# Altium project Walkman.PrjPcb
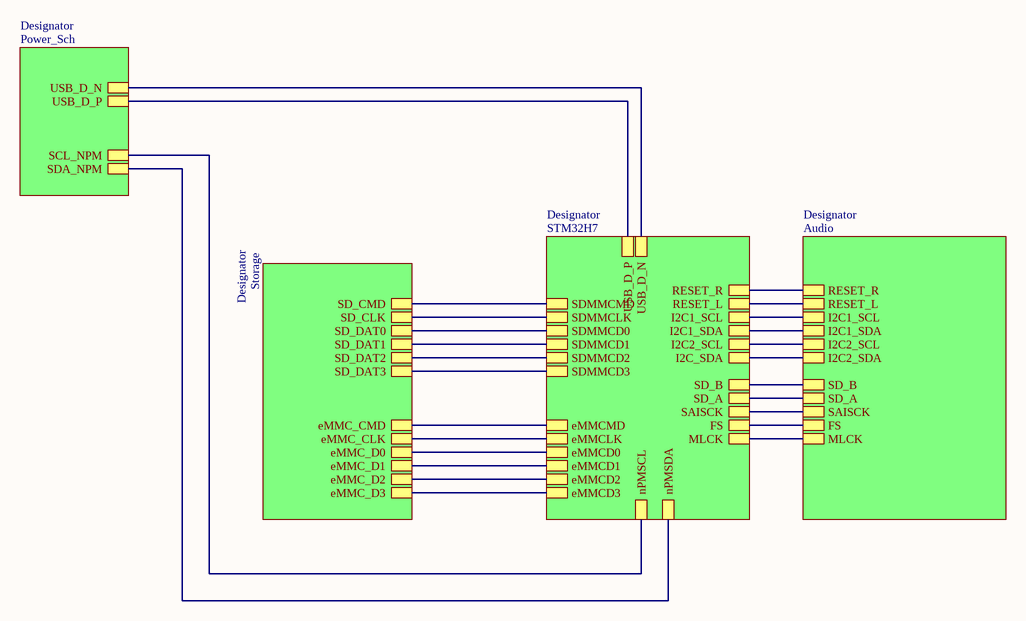
[diagram p0: Master_Schematic.SchDoc]
7 sheets, 80 parts. Net scope: hierarchical (ports join the sheet entries above them; power ports are global).
Board files: PCB1.PcbDoc, PCB2.PcbDoc, PCjnB3.PcbDoc
Sheets:
  Master_Schematic.SchDoc
    Designator = STM32H7.SchDoc
    Designator = Audio.SchDoc
    Designator = Storage.SchDoc
    Designator = Power_Sch.SchDoc
  allparts.SchDoc
  Sheet2.SchDoc

## Sheet Master_Schematic.SchDoc
size A4; SheetNumber: 1; SheetTotal: 7

### Sub-sheets
Designator = STM32H7: eMMCD3, eMMCD2, eMMCD1, eMMCD0, eMMCLK, eMMCMD, SDMMCD1, SDMMCD0, SDMMCD2, SDMMCD3, SDMMCMD, SDMMCLK, RESET_R, RESET_L, I2C_SDA, I2C1_SCL, I2C2_SCL, I2C1_SDA, MLCK, SAISCK, FS, SD_B, SD_A, nPMSDA, nPMSCL, USB_D_N, USB_D_P
Designator = Audio: MLCK, FS, SAISCK, SD_A, SD_B, I2C2_SDA, I2C2_SCL, I2C1_SDA, I2C1_SCL, RESET_R, RESET_L
Designator = Storage: eMMC_CMD, eMMC_CLK, eMMC_D0, eMMC_D1, eMMC_D2, eMMC_D3, SD_CMD, SD_CLK, SD_DAT0, SD_DAT1, SD_DAT2, SD_DAT3
Designator = Power_Sch: SDA_NPM, SCL_NPM, USB_D_P, USB_D_N

### Nets
eMMC_CLK: sheet Designator/eMMCLK, sheet Designator/eMMC_CLK
eMMC_CMD: sheet Designator/eMMCMD, sheet Designator/eMMC_CMD
eMMC_D0: sheet Designator/eMMCD0, sheet Designator/eMMC_D0
eMMC_D1: sheet Designator/eMMCD1, sheet Designator/eMMC_D1
eMMC_D2: sheet Designator/eMMCD2, sheet Designator/eMMC_D2
eMMC_D3: sheet Designator/eMMCD3, sheet Designator/eMMC_D3
FS: sheet Designator/FS, sheet Designator/FS
I2C1_SCL: sheet Designator/I2C1_SCL, sheet Designator/I2C1_SCL
I2C1_SDA: sheet Designator/I2C1_SDA, sheet Designator/I2C1_SDA
I2C2_SCL: sheet Designator/I2C2_SCL, sheet Designator/I2C2_SCL
I2C2_SDA: sheet Designator/I2C_SDA, sheet Designator/I2C2_SDA
MLCK: sheet Designator/MLCK, sheet Designator/MLCK
nPMSCL: sheet Designator/nPMSCL, sheet Designator/SCL_NPM
nPMSDA: sheet Designator/nPMSDA, sheet Designator/SDA_NPM
RESET_L: sheet Designator/RESET_L, sheet Designator/RESET_L
RESET_R: sheet Designator/RESET_R, sheet Designator/RESET_R
SAISCK: sheet Designator/SAISCK, sheet Designator/SAISCK
SD_A: sheet Designator/SD_A, sheet Designator/SD_A
SD_B: sheet Designator/SD_B, sheet Designator/SD_B
SD_CLK: sheet Designator/SDMMCLK, sheet Designator/SD_CLK
SD_CMD: sheet Designator/SDMMCMD, sheet Designator/SD_CMD
SD_DAT0: sheet Designator/SDMMCD0, sheet Designator/SD_DAT0
SD_DAT1: sheet Designator/SDMMCD1, sheet Designator/SD_DAT1
SD_DAT2: sheet Designator/SDMMCD2, sheet Designator/SD_DAT2
SD_DAT3: sheet Designator/SDMMCD3, sheet Designator/SD_DAT3
USB_D_N: sheet Designator/USB_D_N, sheet Designator/USB_D_N
USB_D_P: sheet Designator/USB_D_P, sheet Designator/USB_D_P

## Sheet STM32H7.SchDoc
size A4; SheetNumber: 3; SheetTotal: 7
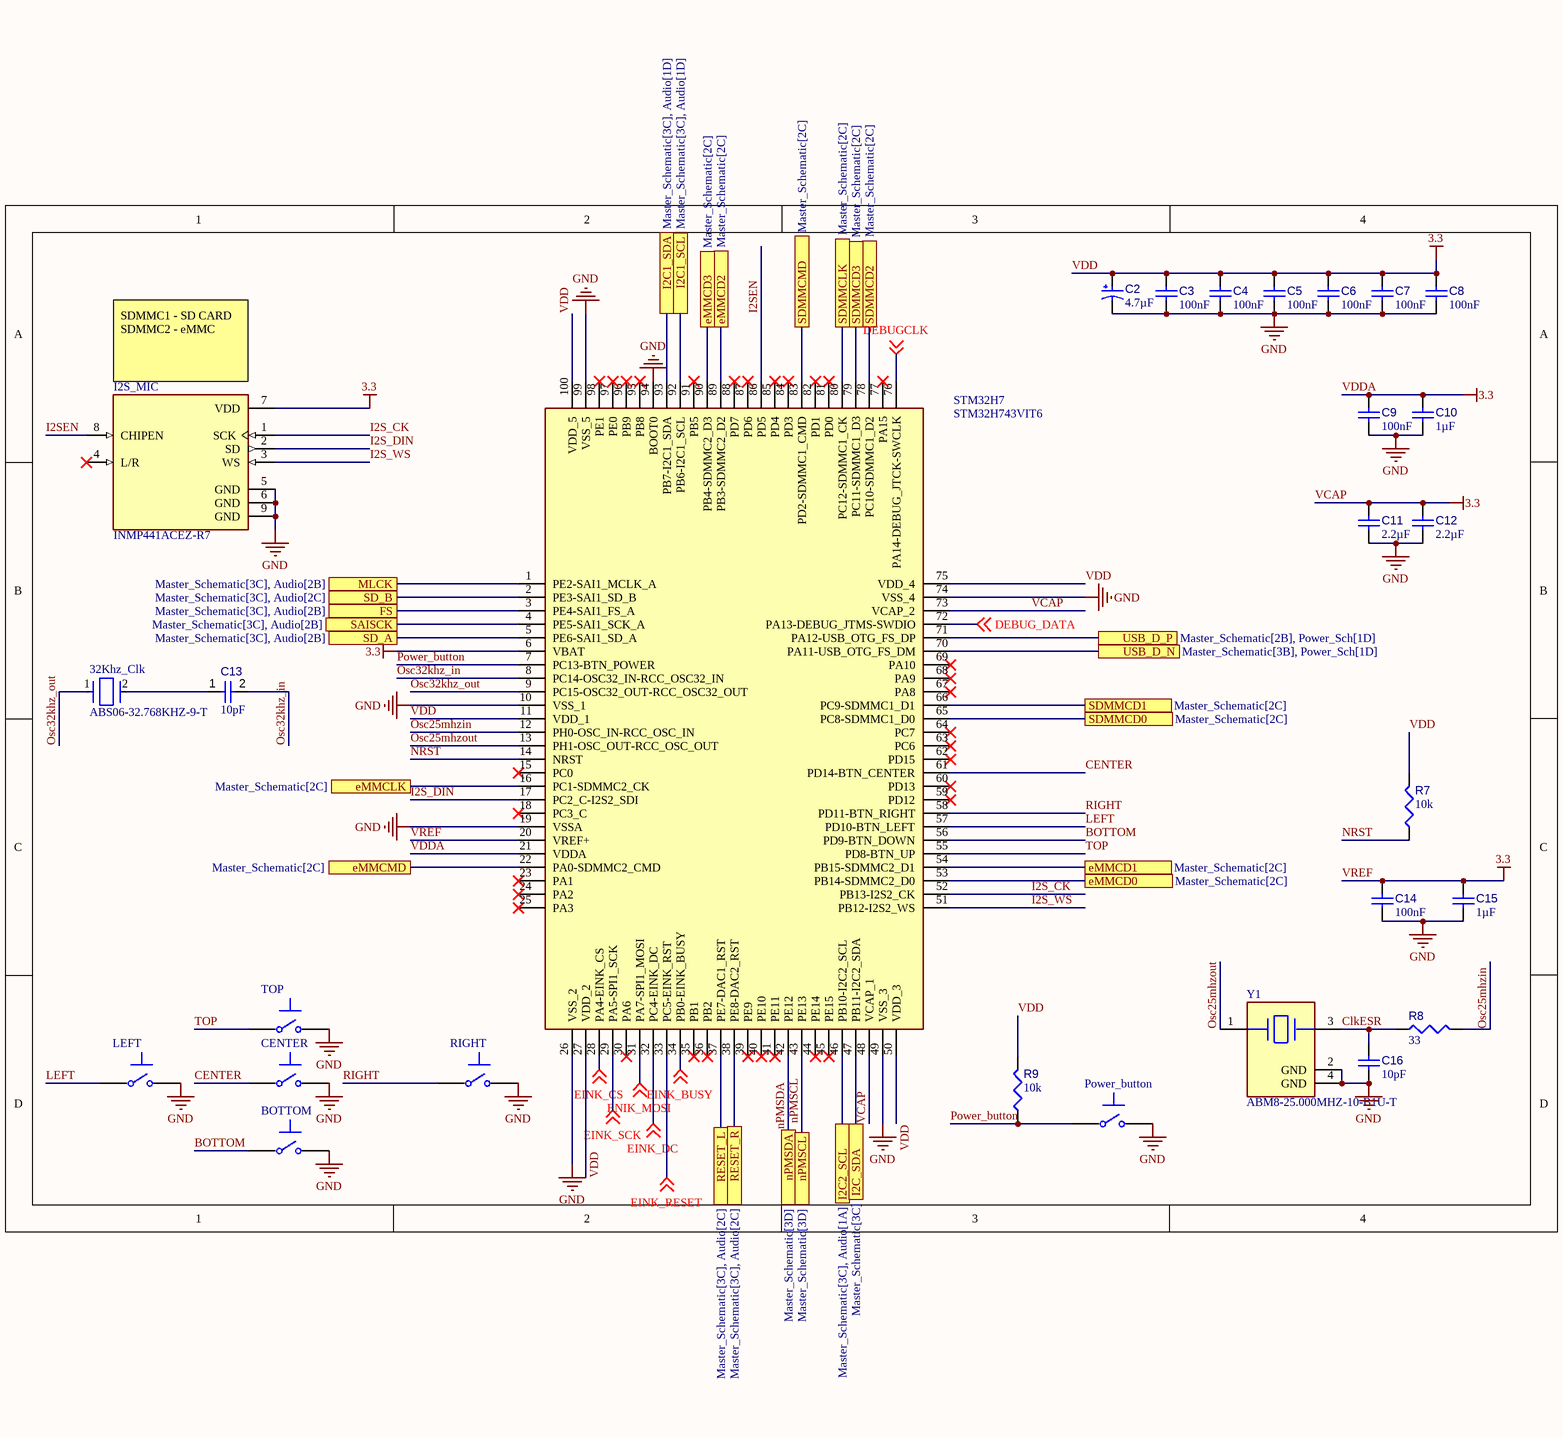
[diagram p1: STM32H7.SchDoc]

### Parts
32Khz_Clk  ABS06-32.768KHZ-9-T  [FP-ABS06-MFG]
BOTTOM  TL1015AF160QG  [FP-TL1015AF160QG-MFG]  (value not drawn)
C2  value 4.7µF  [AVX-TAJ-A-2_L]  (hidden comment: TAJA475K016RNJ)
C3  value 100nF  [CAPC0402(1005)60_L]  (hidden comment: Capacitor 100nF +/-20% 50V 0402)
C4  value 100nF  [CAPC0402(1005)60_L]  (hidden comment: Capacitor 100nF +/-20% 50V 0402)
C5  value 100nF  [CAPC0402(1005)60_L]  (hidden comment: Capacitor 100nF +/-20% 50V 0402)
C6  value 100nF  [CAPC0402(1005)60_L]  (hidden comment: Capacitor 100nF +/-20% 50V 0402)
C7  value 100nF  [CAPC0402(1005)60_L]  (hidden comment: Capacitor 100nF +/-20% 50V 0402)
C8  value 100nF  [CAPC0402(1005)60_L]  (hidden comment: Capacitor 100nF +/-20% 50V 0402)
C9  value 100nF  [CAPC0402(1005)60_L]  (hidden comment: Capacitor 100nF +/-20% 50V 0402)
C10  value 1µF  [CAPC1005X55X25LL05T10]  (hidden comment: Capacitor 1 uF +/- 10% 6.3 V 0402)
C11  value 2.2µF  [CAPC0402(1005)60_L]  (hidden comment: Capacitor 2,2µF +/-20% 10V 0402)
C12  value 2.2µF  [CAPC0402(1005)60_L]  (hidden comment: Capacitor 2,2µF +/-20% 10V 0402)
C13  value 10pF  [CAPC1005X55X25ML05T05]  (hidden comment: Capacitor 10 pF +/- 5% 50 V 0402)
C14  value 100nF  [CAPC1608X90X40NL10T20]  (hidden comment: Capacitor 100 nF +/-10% 50 V 0603)
C15  value 1µF  [CAPC1005X55X25LL05T10]  (hidden comment: Capacitor 1 uF +/- 10% 6.3 V 0402)
C16  value 10pF  [CAPC1608X87X35NL15T15]  (hidden comment: Capacitor 10 pF +/- 0.25 pF 50 V 0603)
CENTER  TL1015AF160QG  [FP-TL1015AF160QG-MFG]  (value not drawn)
I2S_MIC  INMP441ACEZ-R7  [MIC_INMP441ACEZ-R7]
LEFT  TL1015AF160QG  [FP-TL1015AF160QG-MFG]  (value not drawn)
Power_button  TL1015AF160QG  [FP-TL1015AF160QG-MFG]  (value not drawn)
R7  value 10k  [RESC0402(1005)_L]  (hidden comment: 10KR2F)
R8  value 33  [RESC0402(1005)_L]  (hidden comment: 33R2J)
R9  value 10k  [RESC0402(1005)_L]  (hidden comment: 10KR2F)
RIGHT  TL1015AF160QG  [FP-TL1015AF160QG-MFG]  (value not drawn)
STM32H7  STM32H743VIT6  [QFP50P1600X1600X160-100N]
TOP  TL1015AF160QG  [FP-TL1015AF160QG-MFG]  (value not drawn)
Y1  ABM8-25.000MHZ-10-B1U-T  [FP-ABM8-MFG]

### Ports
eMMCD0 (see Master_Schematic[2C]), eMMCD1 (see Master_Schematic[2C]), eMMCD2 (see Master_Schematic[2C]), eMMCD3 (see Master_Schematic[2C]), eMMCLK (see Master_Schematic[2C]), eMMCMD (see Master_Schematic[2C]), FS (see Master_Schematic[3C], Audio[2B]), I2C1_SCL (see Master_Schematic[3C], Audio[1D]), I2C1_SDA (see Master_Schematic[3C], Audio[1D]), I2C2_SCL (see Master_Schematic[3C], Audio[1A]), I2C_SDA (see Master_Schematic[3C]), MLCK (see Master_Schematic[3C], Audio[2B]), nPMSCL (see Master_Schematic[3D]), nPMSDA (see Master_Schematic[3D]), RESET_L (see Master_Schematic[3C], Audio[2C]), RESET_R (see Master_Schematic[3C], Audio[2C]), SAISCK (see Master_Schematic[3C], Audio[2B]), SD_A (see Master_Schematic[3C], Audio[2B]), SD_B (see Master_Schematic[3C], Audio[2C]), SDMMCD0 (see Master_Schematic[2C]), SDMMCD1 (see Master_Schematic[2C]), SDMMCD2 (see Master_Schematic[2C]), SDMMCD3 (see Master_Schematic[2C]), SDMMCLK (see Master_Schematic[2C]), SDMMCMD (see Master_Schematic[2C]), USB_D_N (see Master_Schematic[3B], Power_Sch[1D]), USB_D_P (see Master_Schematic[2B], Power_Sch[1D])

### Nets
GND: BOTTOM.2 C2.2 C3.1 C4.1 C5.1 C6.1 C7.1 C8.1 C9.1 C10.1 C11.1 C12.1 C14.1 C15.1 C16.1 CENTER.2 I2S_MIC.5(GND) I2S_MIC.6(GND) I2S_MIC.9(GND) LEFT.2 Power_button.2 RIGHT.2 STM32H7.10(VSS_1) STM32H7.19(VSSA) STM32H7.26(VSS_2) STM32H7.49(VSS_3) STM32H7.74(VSS_4) STM32H7.94(BOOT0) STM32H7.99(VSS_5) TOP.2 Y1.2(GND) Y1.4(GND)
VCAP: C2.1 C3.2 C4.2 C5.2 C6.2 C7.2 C8.2 C9.2 C10.2 C11.2 C12.2 C14.2 C15.2 I2S_MIC.7(VDD) R7.2 R9.2 STM32H7.6(VBAT) STM32H7.11(VDD_1) STM32H7.20(VREF+) STM32H7.21(VDDA) STM32H7.27(VDD_2) STM32H7.48(VCAP_1) STM32H7.50(VDD_3) STM32H7.73(VCAP_2) STM32H7.75(VDD_4) STM32H7.100(VDD_5)  [also labelled 3.3, VDD, VDDA, VREF]
BOTTOM: BOTTOM.1 STM32H7.56(PD9-BTN_DOWN)
CENTER: CENTER.1 STM32H7.61(PD14-BTN_CENTER)
ClkESR: C16.2 R8.1 Y1.3
DEBUG_DATA: STM32H7.72(PA13-DEBUG_JTMS-SWDIO) ; off-sheet DEBUG_DATA
DEBUGCLK: STM32H7.76(PA14-DEBUG_JTCK-SWCLK) ; off-sheet DEBUGCLK
EINK_BUSY: STM32H7.34(PB0-EINK_BUSY) ; off-sheet EINK_BUSY
EINK_CS: STM32H7.28(PA4-EINK_CS) ; off-sheet EINK_CS
EINK_DC: STM32H7.32(PC4-EINK_DC) ; off-sheet EINK_DC
EINK_RESET: STM32H7.33(PC5-EINK_RST) ; off-sheet EINK_RESET
EINK_SCK: STM32H7.29(PA5-SPI1_SCK) ; off-sheet EINK_SCK
eMMC_CLK: STM32H7.16(PC1-SDMMC2_CK) ; port eMMCLK
eMMC_CMD: STM32H7.22(PA0-SDMMC2_CMD) ; port eMMCMD
eMMC_D0: STM32H7.53(PB14-SDMMC2_D0) ; port eMMCD0
eMMC_D1: STM32H7.54(PB15-SDMMC2_D1) ; port eMMCD1
eMMC_D2: STM32H7.89(PB3-SDMMC2_D2) ; port eMMCD2
eMMC_D3: STM32H7.90(PB4-SDMMC2_D3) ; port eMMCD3
ENIK_MOSI: STM32H7.31(PA7-SPI1_MOSI) ; off-sheet ENIK_MOSI
FS: STM32H7.3(PE4-SAI1_FS_A) ; port FS
I2C1_SCL: STM32H7.92(PB6-I2C1_SCL) ; port I2C1_SCL
I2C1_SDA: STM32H7.93(PB7-I2C1_SDA) ; port I2C1_SDA
I2C2_SCL: STM32H7.46(PB10-I2C2_SCL) ; port I2C2_SCL
I2C2_SDA: STM32H7.47(PB11-I2C2_SDA) ; port I2C_SDA
I2S_CK: I2S_MIC.1(SCK) STM32H7.52(PB13-I2S2_CK)
I2S_DIN: I2S_MIC.2(SD) STM32H7.17(PC2_C-I2S2_SDI)
I2S_WS: I2S_MIC.3(WS) STM32H7.51(PB12-I2S2_WS)
I2SEN: I2S_MIC.8(CHIPEN) STM32H7.86(PD5)
LEFT: LEFT.1 STM32H7.57(PD10-BTN_LEFT)
MLCK: STM32H7.1(PE2-SAI1_MCLK_A) ; port MLCK
nPMSCL: STM32H7.43(PE13) ; port nPMSCL
nPMSDA: STM32H7.42(PE12) ; port nPMSDA
NRST: R7.1 STM32H7.14(NRST)
Osc25mhzin: R8.2 STM32H7.12(PH0-OSC_IN-RCC_OSC_IN)
Osc25mhzout: STM32H7.13(PH1-OSC_OUT-RCC_OSC_OUT) Y1.1
Osc32khz_in: C13.2 STM32H7.8(PC14-OSC32_IN-RCC_OSC32_IN)
Osc32khz_out: 32Khz_Clk.1 STM32H7.9(PC15-OSC32_OUT-RCC_OSC32_OUT)
Power_button: Power_button.1 R9.1 STM32H7.7(PC13-BTN_POWER)
RESET_L: STM32H7.37(PE7-DAC1_RST) ; port RESET_L
RESET_R: STM32H7.38(PE8-DAC2_RST) ; port RESET_R
RIGHT: RIGHT.1 STM32H7.58(PD11-BTN_RIGHT)
SAISCK: STM32H7.4(PE5-SAI1_SCK_A) ; port SAISCK
SD_A: STM32H7.5(PE6-SAI1_SD_A) ; port SD_A
SD_B: STM32H7.2(PE3-SAI1_SD_B) ; port SD_B
SD_CLK: STM32H7.80(PC12-SDMMC1_CK) ; port SDMMCLK
SD_CMD: STM32H7.83(PD2-SDMMC1_CMD) ; port SDMMCMD
SD_DAT0: STM32H7.65(PC8-SDMMC1_D0) ; port SDMMCD0
SD_DAT1: STM32H7.66(PC9-SDMMC1_D1) ; port SDMMCD1
SD_DAT2: STM32H7.78(PC10-SDMMC1_D2) ; port SDMMCD2
SD_DAT3: STM32H7.79(PC11-SDMMC1_D3) ; port SDMMCD3
TOP: STM32H7.55(PD8-BTN_UP) TOP.1
USB_D_N: STM32H7.70(PA11-USB_OTG_FS_DM) ; port USB_D_N
USB_D_P: STM32H7.71(PA12-USB_OTG_FS_DP) ; port USB_D_P
Net32Khz_Clk_2: 32Khz_Clk.2 C13.1

Not connected (* = marked no-connect by the designer): I2S_MIC 4(L/R)*; STM32H7 15(PC0)* 18(PC3_C)* 23(PA1)* 24(PA2)* 25(PA3)* 30(PA6)* 35(PB1)* 36(PB2)* 39(PE9)* 40(PE10)* 41(PE11)* 44(PE14)* 45(PE15)* 59(PD12)* 60(PD13)* 62(PD15)* 63(PC6)* 64(PC7)* 67(PA8)* 68(PA9)* 69(PA10)* 77(PA15)* 81(PD0)* 82(PD1)* 84(PD3)* 85(PD4)* 87(PD6)* 88(PD7)* 91(PB5)* 95(PB8)* 96(PB9)* 97(PE0)* 98(PE1)*

### Notes on the sheet
- (near I2S_MIC) SDMMC1 - SD CARD
  SDMMC2 - eMMC

### Library data of the parts
32Khz_Clk = CMP-27762-015421-1: Crystal 32.768kHz ±20ppm (Tol) 9pF FUND 90kΩ 2-Pin Mini-CSMD T/R; ESR (Equivalent Series Resistance): 90kR; Max Operating Temperature: 85°C; Frequency Tolerance: 20ppm; Case/Package: CSMD; Termination: SMD/SMT; RoHS Compliant: Yes; Height: 0.6mm; Load Capacitance: 9pF; Packaging: Tape and Reel; Depth: 1.2mm; Tolerance: 20ppm; Frequency: 32.768kHz; Series: ABS06; Width: 1.2mm; Length: 2mm; Number of Pins: 2; Min Operating Temperature: -40°C; Mount: Surface Mount; Lead Free: Lead Free; Package Quantity: 3000
BOTTOM CENTER LEFT Power_button RIGHT TOP = CMP-17879-000003-1: SWITCH TACTILE SPST-NO 0.05A 12V; Actuator Type: Standard; Actuator Length: 0.5mm; Contact Current Rating: 50mA; Mechanical Life: 200000Cycles; Switch Function: Off-Mom; Switch Travel: 0.2mm; Illumination Type: Non-Illuminated; Operating Force: 160gf; Actuator Material: Nylon; Electrical Life: 50000Cycles; Throw Configuration: SPST; Contact Resistance: 100mR; Orientation: Straight; Max Voltage Rating (DC): 12V; Max Operating Temperature: 70°C; Package Quantity: 1; Contact Material: Silver; Packaging: Tape and Reel; Mount: Surface Mount; Color: Beige; Termination: Gull Wing; Case/Package: SMD/SMT; Voltage Rating (DC): 12V; Contact Plating: Silver; REACH SVHC: No SVHC; Min Operating Temperature: -20°C; Current Rating: 50mA; Lead Free: Lead Free
C2 = CMP-001-00042-7: Standard Tantalum, 4.7 uF, +/- 10%, 16 V, -55 to 125 degC, 1206 (3216 Metric), RoHS, Tape and Reel; Manufacturer: AVX; Resistance: 4Ohm; Voltage Rating: 16V; Manufacturer URL: http://www.avx.com/; Pins: 2; Max Operating Temperature: 125°C; Case/Package: 1206; Package Description: 2-Pin Surface Mount Device, Body 3.2 x 1.65 mm; Datasheet URL: http://datasheets.avx.com/TAJ.pdf; Min Operating Temperature: -55°C; RoHS Compliant: True; Package Reference: TAJ-A-2; ESR: 4Ohm; Capacitor Type: Tantalum; Packaging: TapeandReel; Datasheet Version: Feb-16; Tolerance: 10%; Mounting Technology: SM; Package Quantity: 2000
C3-C9 = CMP-001-00067-3: Chip Capacitor, 100nF +/-20%, 50V, 0402, Thickness 0.6 mm; Tolerance: 10%; Min Operating Temperature: -55°C; Pins: 2; Case/Package: 0402; Max Operating Temperature: 85°C; Voltage Rating: 50V; Mounting Technology: SMT
C10 C15 = CMP-001-00008-6: Chip Capacitor, 1 uF, +/- 10%, 6.3 V, 0402 (1005 Metric); Capacitor Type: Ceramic; Voltage Rating: 6.3V; Max Operating Temperature: 85°C; Mounting Technology: SM; Tolerance: 10%; Case/Package: 0402; RoHS Compliant: True; Min Operating Temperature: -55°C; Pins: 2
C11 C12 = CMP-001-00056-4: Chip Capacitor, 2,2µF +/-20%, 10V, 0402, Thickness 0.6 mm; Tolerance: 10%; Mounting Technology: SMT; Max Operating Temperature: 85°C; Case/Package: 0402; Pins: 2; Min Operating Temperature: -55°C; Voltage Rating: 10V
C13 = CMP-001-00013-6: Chip Capacitor, 10 pF, +/- 5%, 50 V, 0402 (1005 Metric); Capacitor Type: Ceramic; Voltage Rating: 50V; Max Operating Temperature: 125°C; Pins: 2; Mounting Technology: SM; Tolerance: 5%; RoHS Compliant: True; Case/Package: 0402; Min Operating Temperature: -55°C
C14 = CMP-001-00017-6: Chip Capacitor, 100 nF, +/- 10%, 50 V, 0603 (1608 Metric); Voltage Rating: 50V; Capacitor Type: Ceramic; Tolerance: 10%; Mounting Technology: SM; Max Operating Temperature: 125°C; RoHS Compliant: True; Pins: 2; Case/Package: 0603; Min Operating Temperature: -55°C
C16 = CMP-001-00012-6: Chip Capacitor, 10 pF, +/- 0.25 pF, 50 V, 0603 (1608 Metric); Tolerance: 0.25%; Capacitor Type: Ceramic; Voltage Rating: 50V; Max Operating Temperature: 125°C; RoHS Compliant: True; Mounting Technology: SM; Pins: 2; Case/Package: 0603; Min Operating Temperature: -55°C
I2S_MIC = CMP-062-000000-1: 60 Hz ~ 15 kHz Digital, I2S Microphone MEMS (Silicon) 1.62 V ~ 3.63 V Omnidirectional (-26dB Â±3dB @ 94dB SPL) Solder Pads; MF: TDK InvenSense; Source: INMP441ACEZ-R7.SchLib; Check_prices: https://www.snapeda.com/parts/INMP441ACEZ-R7/TDK/view-part/?ref=eda; MP: INMP441ACEZ-R7; Design Item ID: INMP441ACEZ-R7; Pin Count: 9; Component Type: Standard; SnapEDA_Link: https://www.snapeda.com/parts/INMP441ACEZ-R7/TDK/view-part/?ref=snap; Package: LGA-9 TDK InvenSense; Value: *
R7 R9 = CMP-009-00066-2: 10K 0.063W 1% 0402 (1005 Metric)  SMD; Power: 63mW; Case/Package: 0402; Mounting Technology: SMT; Pins: 2; Tolerance: 1%
R8 = CMP-009-00096-2: 33R 0.063W 5% 0402 (1005 Metric)  SMD; Power: 63mW; Mounting Technology: SMT; Tolerance: 5%; Case/Package: 0402; Pins: 2
STM32H7 = CMP-060-000000-1: ARM Microcontrollers - MCU High-performance and DSP with DP-FPU, ARM Cortex-M7 MCU with 2MBytes Flash, 1MB RAM, 400 MHz CPU, Art Accelerator, L1 cache, external memory interface, large set of peripherals; Manufacturer_Name: STMicroelectronics; Geometry.Height: 1.6mm; Manufacturer_Part_Number: STM32H743VIT6; Source: STM32H743VIT6.SchLib; Design Item ID: STM32H743VIT6; Datasheet Link: https://www.st.com/resource/en/datasheet/stm32h743vi.pdf
Y1 = CMP-27762-006353-1: Crystal 25MHz ±10ppm 10pF SMD-4 3.2mm x 2.5mm

## Sheet Audio.SchDoc
size A4; SheetNumber: 2; SheetTotal: 7
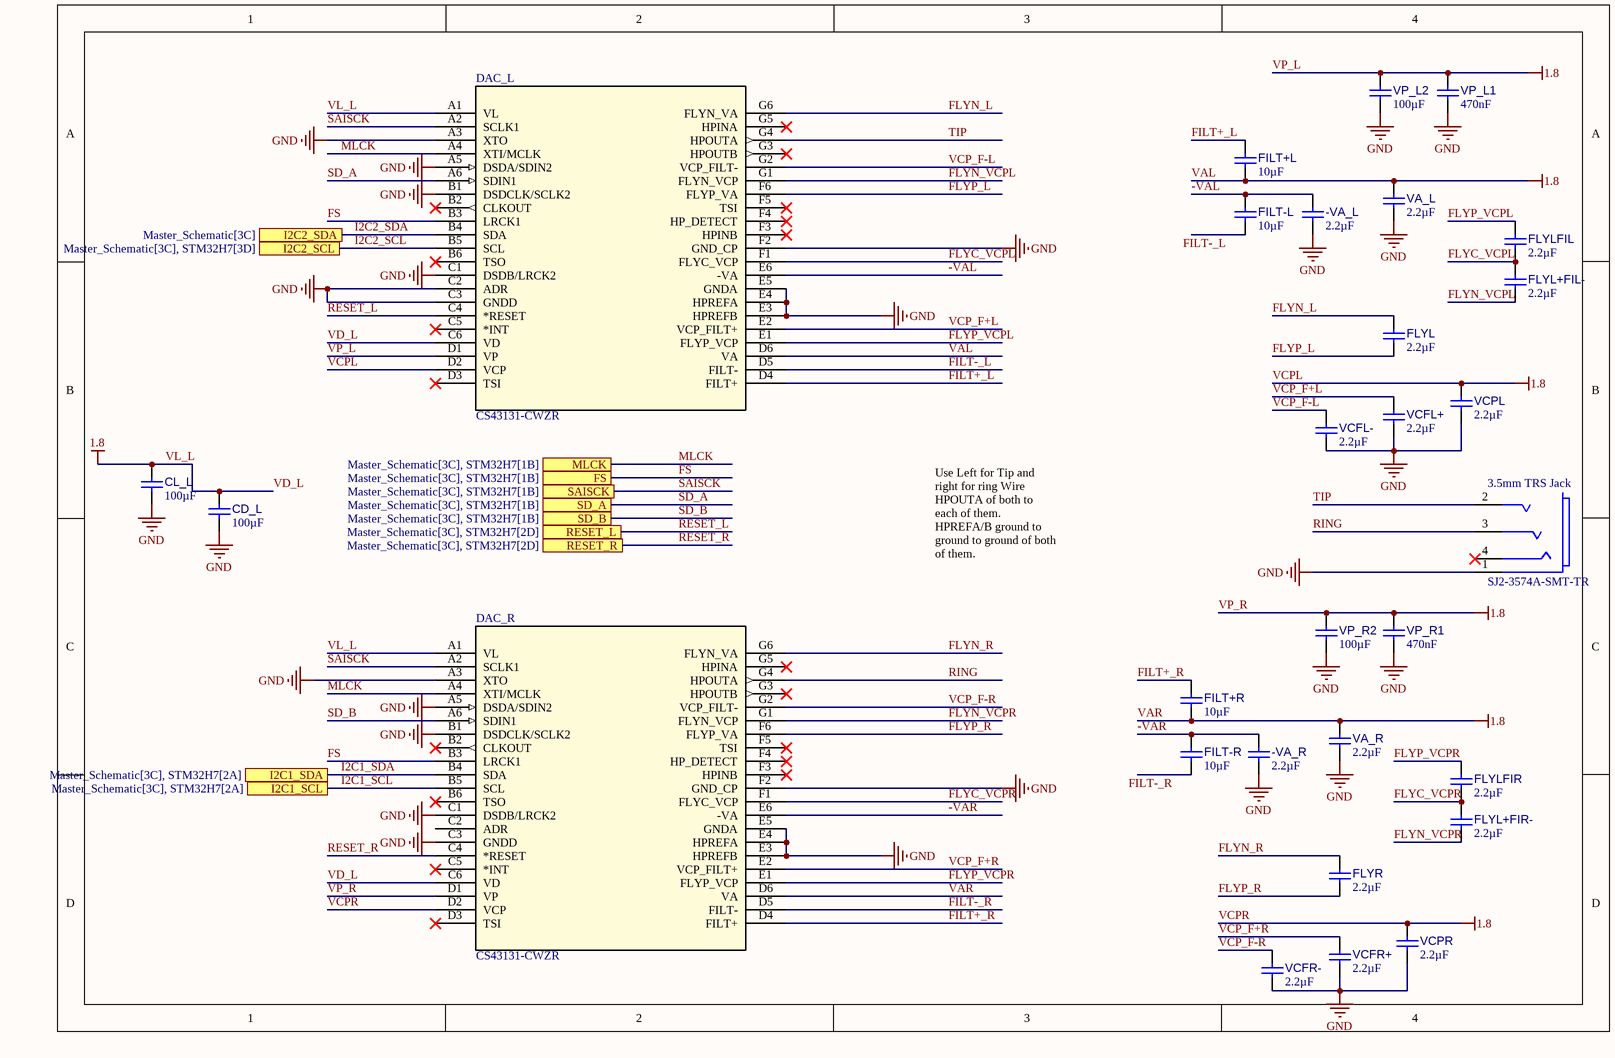
[diagram p2: Audio.SchDoc]

### Parts
(Parts that share a designator on the sheet are numbered #1, #2 ... from top to bottom, then left to right.)
3.5mm_TRS_Jack#1  SJ2-3574A-SMT-TR  [FP-SJ2-3574A-SMT-TR-MFG]
-VA_L  value 2.2µF  [CAPC0402(1005)60_L]  (hidden comment: Capacitor 2,2µF +/-20% 10V 0402)
-VA_R  value 2.2µF  [CAPC0402(1005)60_L]  (hidden comment: Capacitor 2,2µF +/-20% 10V 0402)
CD_L  value 100µF  [CAPC3216X190X55LL30T25]  (hidden comment: Capacitor 100 uF +/- 20% 6.3 V 1206)
CL_L  value 100µF  [CAPC3216X190X55LL30T25]  (hidden comment: Capacitor 100 uF +/- 20% 6.3 V 1206)
DAC_L  CS43131-CWZR  [WLCSP42_CS43131-CWZR_CIR]
DAC_R  CS43131-CWZR  [WLCSP42_CS43131-CWZR_CIR]
FILT+L  value 10µF  [CAPC0603(1608)100_L]  (hidden comment: Capacitor 10µF +/-20% 10V 0603)
FILT+R  value 10µF  [CAPC0603(1608)100_L]  (hidden comment: Capacitor 10µF +/-20% 10V 0603)
FILT-L  value 10µF  [CAPC0603(1608)100_L]  (hidden comment: Capacitor 10µF +/-20% 10V 0603)
FILT-R  value 10µF  [CAPC0603(1608)100_L]  (hidden comment: Capacitor 10µF +/-20% 10V 0603)
FLYL  value 2.2µF  [CAPC0402(1005)60_L]  (hidden comment: Capacitor 2,2µF +/-20% 10V 0402)
FLYL+FIL-  value 2.2µF  [CAPC0402(1005)60_L]  (hidden comment: Capacitor 2,2µF +/-20% 10V 0402)
FLYL+FIR-  value 2.2µF  [CAPC0402(1005)60_L]  (hidden comment: Capacitor 2,2µF +/-20% 10V 0402)
FLYLFIL  value 2.2µF  [CAPC0402(1005)60_L]  (hidden comment: Capacitor 2,2µF +/-20% 10V 0402)
FLYLFIR  value 2.2µF  [CAPC0402(1005)60_L]  (hidden comment: Capacitor 2,2µF +/-20% 10V 0402)
FLYR  value 2.2µF  [CAPC0402(1005)60_L]  (hidden comment: Capacitor 2,2µF +/-20% 10V 0402)
VA_L  value 2.2µF  [CAPC0402(1005)60_L]  (hidden comment: Capacitor 2,2µF +/-20% 10V 0402)
VA_R  value 2.2µF  [CAPC0402(1005)60_L]  (hidden comment: Capacitor 2,2µF +/-20% 10V 0402)
VCFL+  value 2.2µF  [CAPC0402(1005)60_L]  (hidden comment: Capacitor 2,2µF +/-20% 10V 0402)
VCFL-  value 2.2µF  [CAPC0402(1005)60_L]  (hidden comment: Capacitor 2,2µF +/-20% 10V 0402)
VCFR+  value 2.2µF  [CAPC0402(1005)60_L]  (hidden comment: Capacitor 2,2µF +/-20% 10V 0402)
VCFR-  value 2.2µF  [CAPC0402(1005)60_L]  (hidden comment: Capacitor 2,2µF +/-20% 10V 0402)
VCPL  value 2.2µF  [CAPC0402(1005)60_L]  (hidden comment: Capacitor 2,2µF +/-20% 10V 0402)
VCPR  value 2.2µF  [CAPC0402(1005)60_L]  (hidden comment: Capacitor 2,2µF +/-20% 10V 0402)
VP_L1  value 470nF  [CAPC0402(1005)60_L]  (hidden comment: Capacitor 470nF +/-40% 10V 0402)
VP_L2  value 100µF  [CAPC3216X190X55LL30T25]  (hidden comment: Capacitor 100 uF +/- 20% 6.3 V 1206)
VP_R1  value 470nF  [CAPC0402(1005)60_L]  (hidden comment: Capacitor 470nF +/-40% 10V 0402)
VP_R2  value 100µF  [CAPC3216X190X55LL30T25]  (hidden comment: Capacitor 100 uF +/- 20% 6.3 V 1206)

### Ports
FS (see Master_Schematic[3C], STM32H7[1B]), I2C1_SCL (see Master_Schematic[3C], STM32H7[2A]), I2C1_SDA (see Master_Schematic[3C], STM32H7[2A]), I2C2_SCL (see Master_Schematic[3C], STM32H7[3D]), I2C2_SDA (see Master_Schematic[3C]), MLCK (see Master_Schematic[3C], STM32H7[1B]), RESET_L (see Master_Schematic[3C], STM32H7[2D]), RESET_R (see Master_Schematic[3C], STM32H7[2D]), SAISCK (see Master_Schematic[3C], STM32H7[1B]), SD_A (see Master_Schematic[3C], STM32H7[1B]), SD_B (see Master_Schematic[3C], STM32H7[1B])

### Nets
GND: 3.5mm_TRS_Jack#1.1(sleeve) -VA_L.1 -VA_R.1 CD_L.1 CL_L.1 DAC_L.A3(XTO) DAC_L.A5(DSDA/SDIN2) DAC_L.B1(DSDCLK/SCLK2) DAC_L.C1(DSDB/LRCK2) DAC_L.C2(ADR) DAC_L.C3(GNDD) DAC_L.E3(HPREFB) DAC_L.E4(HPREFA) DAC_L.E5(GNDA) DAC_L.F2(GND_CP) DAC_R.A3(XTO) DAC_R.A5(DSDA/SDIN2) DAC_R.B1(DSDCLK/SCLK2) DAC_R.C1(DSDB/LRCK2) DAC_R.C3(GNDD) DAC_R.E3(HPREFB) DAC_R.E4(HPREFA) DAC_R.E5(GNDA) DAC_R.F2(GND_CP) VA_L.1 VA_R.1 VCFL+.1 VCFL-.1 VCFR+.1 VCFR-.1 VCPL.1 VCPR.1 VP_L1.1 VP_L2.1 VP_R1.1 VP_R2.1
VAL: CD_L.2 CL_L.2 DAC_L.A1(VL) DAC_L.C6(VD) DAC_L.D1(VP) DAC_L.D2(VCP) DAC_L.D6(VA) DAC_R.A1(VL) DAC_R.C6(VD) DAC_R.D1(VP) DAC_R.D2(VCP) DAC_R.D6(VA) FILT+L.2 FILT+R.2 VA_L.2 VA_R.2 VCPL.2 VCPR.2 VP_L1.2 VP_L2.2 VP_R1.2 VP_R2.2  [also labelled 1.8, VAR, VCPL, VCPR, VD_L, VL_L, VP_L, VP_R]
-VAL: -VA_L.2 DAC_L.E6(-VA) FILT-L.1
-VAR: -VA_R.2 DAC_R.E6(-VA) FILT-R.1
FILT+_L: DAC_L.D4(FILT+) FILT+L.1
FILT+_R: DAC_R.D4(FILT+) FILT+R.1
FILT-_L: DAC_L.D5(FILT-) FILT-L.2
FILT-_R: DAC_R.D5(FILT-) FILT-R.2
FLYC_VCPL: DAC_L.F1(FLYC_VCP) FLYL+FIL-.2 FLYLFIL.1
FLYC_VCPR: DAC_R.F1(FLYC_VCP) FLYL+FIR-.2 FLYLFIR.1
FLYN_L: DAC_L.G6(FLYN_VA) FLYL.2
FLYN_R: DAC_R.G6(FLYN_VA) FLYR.2
FLYN_VCPL: DAC_L.G1(FLYN_VCP) FLYL+FIL-.1
FLYN_VCPR: DAC_R.G1(FLYN_VCP) FLYL+FIR-.1
FLYP_L: DAC_L.F6(FLYP_VA) FLYL.1
FLYP_R: DAC_R.F6(FLYP_VA) FLYR.1
FLYP_VCPL: DAC_L.E1(FLYP_VCP) FLYLFIL.2
FLYP_VCPR: DAC_R.E1(FLYP_VCP) FLYLFIR.2
FS: DAC_L.B3(LRCK1) DAC_R.B3(LRCK1) ; port FS
I2C1_SCL: DAC_R.B5(SCL) ; port I2C1_SCL
I2C1_SDA: DAC_R.B4(SDA) ; port I2C1_SDA
I2C2_SCL: DAC_L.B5(SCL) ; port I2C2_SCL
I2C2_SDA: DAC_L.B4(SDA) ; port I2C2_SDA
MLCK: DAC_L.A4(XTI/MCLK) DAC_R.A4(XTI/MCLK) ; port MLCK
RESET_L: DAC_L.C4(*RESET) ; port RESET_L
RESET_R: DAC_R.C4(*RESET) ; port RESET_R
RING: 3.5mm_TRS_Jack#1.3(ring_1) DAC_R.G4(HPOUTA)
SAISCK: DAC_L.A2(SCLK1) DAC_R.A2(SCLK1) ; port SAISCK
SD_A: DAC_L.A6(SDIN1) ; port SD_A
SD_B: DAC_R.A6(SDIN1) ; port SD_B
TIP: 3.5mm_TRS_Jack#1.2(tip) DAC_L.G4(HPOUTA)
VCP_F+L: DAC_L.E2(VCP_FILT+) VCFL+.2
VCP_F+R: DAC_R.E2(VCP_FILT+) VCFR+.2
VCP_F-L: DAC_L.G2(VCP_FILT-) VCFL-.2
VCP_F-R: DAC_R.G2(VCP_FILT-) VCFR-.2

Not connected (* = marked no-connect by the designer): 3.5mm_TRS_Jack#1 4(ring_2)*; DAC_L B2(CLKOUT)* B6(TSO)* C5(*INT)* D3(TSI)* F3(HPINB)* F4(HP_DETECT)* F5(TSI)* G3(HPOUTB)* G5(HPINA)*; DAC_R B2(CLKOUT)* B6(TSO)* C2(ADR) C5(*INT)* D3(TSI)* F3(HPINB)* F4(HP_DETECT)* F5(TSI)* G3(HPOUTB)* G5(HPINA)*

### Notes on the sheet
- Use Left for Tip and right for ring Wire HPOUTA of both to each of them. HPREFA/B ground to ground to ground of both of them.

### Library data of the parts
3.5mm_TRS_Jack#1 = CMP-14818-000001-1: AUDIO JACK, 3.5 MM, RT, 4 CONDUC; Manufacturer: CUI; Conn Orientation: Horizontal; Current Rating: 1A; Number Of Contacts: 4; Voltage Rating: 12V; Package: SJ2-3574A-SMT-TR; Device Class L1: Connectors; Lead Free: Yes; Digikey Description: AUDIO JACK, 3.5 MM, RT, 4 CONDUC; Device Class L2: Audio / Video Connectors; ComponentLink2URL: https://www.cui.com/product/resource/sj2-357x-smt.pdf; Automotive: No; RoHS: TRUE; Height: 5.3mm; Temperature Range Low: -25°C; Category: Conn; Temperature: -25°C to +85°C; Octopart: https://octopart.com/sj2-3574a-smt-tr-cui-77838840; Device Class L3: unset; Contact Material: Silver; Manufacturer Part Number: SJ2-3574A-SMT-TR; Temperature Range High: +85°C; ComponentLink2Description: Datasheet
-VA_L -VA_R FLYL FLYL+FIL- FLYL+FIR- FLYLFIL FLYLFIR FLYR VA_L VA_R VCFL+ VCFL- VCFR+ VCFR- VCPL VCPR = CMP-001-00056-4: as C11 on sheet STM32H7; Mounting Technology: SMT; Max Operating Temperature: 85°C; Case/Package: 0402; Pins: 2; Min Operating Temperature: -55°C; Voltage Rating: 10V
CD_L CL_L VP_L2 VP_R2 = CMP-001-00019-6: Chip Capacitor, 100 uF, +/- 20%, 6.3 V, 1206 (3216 Metric); Voltage Rating: 6.3V; Capacitor Type: Ceramic; Tolerance: 20%; Pins: 2; Case/Package: 1206; Max Operating Temperature: 85°C; RoHS Compliant: True; Mounting Technology: SM; Min Operating Temperature: -55°C
DAC_L DAC_R = CMP-057-000000-1: Description; Manufacturer_Name: Cirrus Logic; Design Item ID: CS43131-CWZR; RefDes: RefDes; Source: CS43131-CWZR.SchLib; Manufacturer_Part_Number: CS43131-CWZR; Type: Type; Copyright: Copyright (C) 2025 Ultra Librarian. All rights reserved.
FILT+L FILT+R FILT-L FILT-R = CMP-001-00075-4: Chip Capacitor, 10µF +/-20%, 10V, 0603, Thickness 1 mm; Tolerance: 10%; Voltage Rating: 10V; Max Operating Temperature: 85°C; Pins: 2; Case/Package: 0603; Mounting Technology: SMT; Min Operating Temperature: -55°C
VP_L1 VP_R1 = CMP-001-00060-4: Chip Capacitor, 470nF +/-40%, 10V, 0402, Thickness 0.6 mm; Tolerance: 20%; Max Operating Temperature: 85°C; Case/Package: 0402; Voltage Rating: 10V; Min Operating Temperature: -55°C; Mounting Technology: SMT; Pins: 2

## Sheet Storage.SchDoc
size A4; SheetNumber: 5; SheetTotal: 7
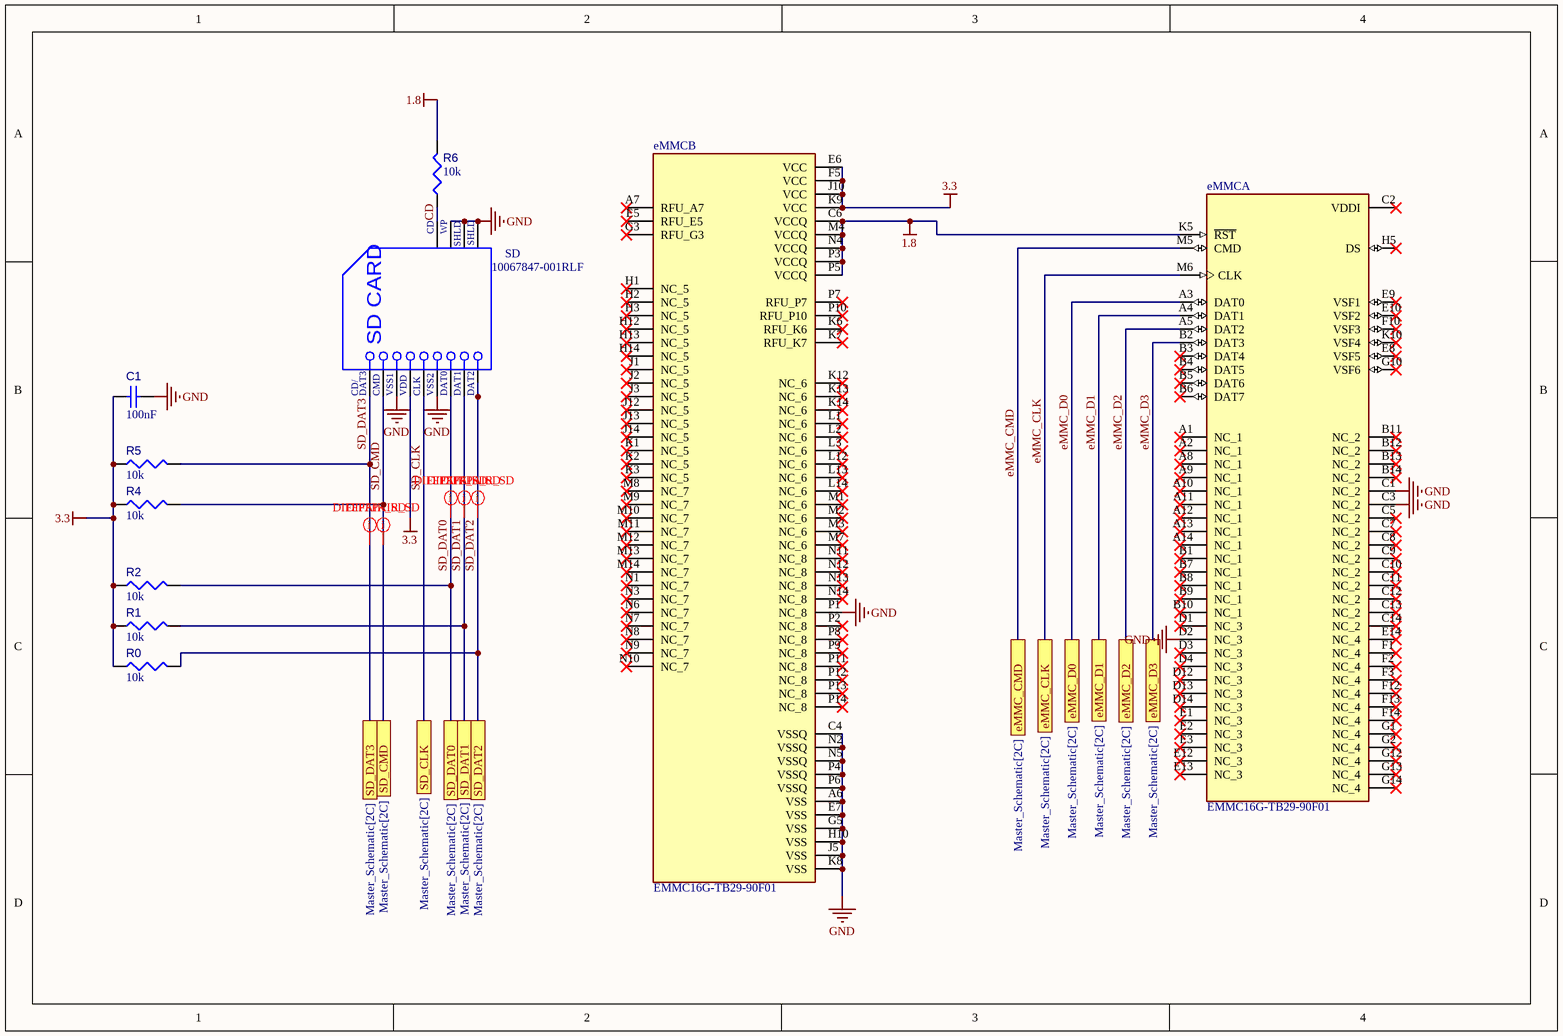
[diagram p3: Storage.SchDoc]

### Parts
C1  value 100nF  [CAPC0402(1005)60_L]  (hidden comment: Capacitor 100nF +/-20% 50V 0402)
eMMC  EMMC16G-TB29-90F01  [BGA153N50P14X14_1300X1150X100N]  (parts A,B of 2)
R0  value 10k  [RESC0402(1005)_L]  (hidden comment: 10KR2F)
R1  value 10k  [RESC0402(1005)_L]  (hidden comment: 10KR2F)
R2  value 10k  [RESC0402(1005)_L]  (hidden comment: 10KR2F)
R4  value 10k  [RESC0402(1005)_L]  (hidden comment: 10KR2F)
R5  value 10k  [RESC0402(1005)_L]  (hidden comment: 10KR2F)
R6  value 10k  [RESC0402(1005)_L]  (hidden comment: 10KR2F)
SD  10067847-001RLF  [FCI-10067847-001RLF_V]

### Ports
eMMC_CLK (see Master_Schematic[2C]), eMMC_CMD (see Master_Schematic[2C]), eMMC_D0 (see Master_Schematic[2C]), eMMC_D1 (see Master_Schematic[2C]), eMMC_D2 (see Master_Schematic[2C]), eMMC_D3 (see Master_Schematic[2C]), SD_CLK (see Master_Schematic[2C]), SD_CMD (see Master_Schematic[2C]), SD_DAT0 (see Master_Schematic[2C]), SD_DAT1 (see Master_Schematic[2C]), SD_DAT2 (see Master_Schematic[2C]), SD_DAT3 (see Master_Schematic[2C])

### Nets
1.8: eMMC.C6(VCCQ) eMMC.K5(~{RST}) eMMC.M4(VCCQ) eMMC.N4(VCCQ) eMMC.P3(VCCQ) eMMC.P5(VCCQ) R6.2  [project net VAL]
3.3: C1.1 eMMC.E6(VCC) eMMC.F5(VCC) eMMC.J10(VCC) eMMC.K9(VCC) R0.1 R1.1 R2.1 R4.1 R5.1 SD.4(VDD)  [project net VCAP]
GND: C1.2 eMMC.A6(VSS) eMMC.C1(NC_2) eMMC.C3(NC_2) eMMC.C4(VSSQ) eMMC.D2(NC_3) eMMC.E7(VSS) eMMC.G5(VSS) eMMC.H10(VSS) eMMC.J5(VSS) eMMC.K8(VSS) eMMC.N2(VSSQ) eMMC.N5(VSSQ) eMMC.P1(NC_8) eMMC.P4(VSSQ) eMMC.P6(VSSQ) SD.3(VSS1) SD.6(VSS2) SD.11(WP) SD.12(SHLD1) SD.13(SHLD2)
CD: R6.1 SD.10(CD)
eMMC_CLK: eMMC.M6(CLK) ; port eMMC_CLK
eMMC_CMD: eMMC.M5(CMD) ; port eMMC_CMD
eMMC_D0: eMMC.A3(DAT0) ; port eMMC_D0
eMMC_D1: eMMC.A4(DAT1) ; port eMMC_D1
eMMC_D2: eMMC.A5(DAT2) ; port eMMC_D2
eMMC_D3: eMMC.B2(DAT3) ; port eMMC_D3
SD_CLK: SD.5(CLK) ; port SD_CLK
SD_CMD: R4.2 SD.2(CMD) ; port SD_CMD
SD_DAT0: R2.2 SD.7(DAT0) ; port SD_DAT0
SD_DAT1: R1.2 SD.8(DAT1) ; port SD_DAT1
SD_DAT2: R0.2 SD.9(DAT2) ; port SD_DAT2
SD_DAT3: R5.2 SD.1(CD/DAT3) ; port SD_DAT3

Not connected (* = marked no-connect by the designer): eMMC A1(NC_1)* A2(NC_1)* A7(RFU_A7)* A8(NC_1)* A9(NC_1)* A10(NC_1)* A11(NC_1)* A12(NC_1)* A13(NC_1)* A14(NC_1)* B1(NC_1)* B3(DAT4)* B4(DAT5)* B5(DAT6)* B6(DAT7)* B7(NC_1)* B8(NC_1)* B9(NC_1)* B10(NC_1)* B11(NC_2)* B12(NC_2)* B13(NC_2)* B14(NC_2)* C2(VDDI)* C5(NC_2)* C7(NC_2)* C8(NC_2)* C9(NC_2)* C10(NC_2)* C11(NC_2)* C12(NC_2)* C13(NC_2)* C14(NC_2)* D1(NC_3)* D3(NC_3)* D4(NC_3)* D12(NC_3)* D13(NC_3)* D14(NC_3)* E1(NC_3)* E2(NC_3)* E3(NC_3)* E5(RFU_E5)* E8(VSF5)* E9(VSF1)* E10(VSF2)* E12(NC_3)* E13(NC_3)* E14(NC_4)* F1(NC_4)* F2(NC_4)* F3(NC_4)* F10(VSF3)* F12(NC_4)* F13(NC_4)* F14(NC_4)* G1(NC_4)* G2(NC_4)* G3(RFU_G3)* G10(VSF6)* G12(NC_4)* G13(NC_4)* G14(NC_4)* H1(NC_5)* H2(NC_5)* H3(NC_5)* H5(DS)* H12(NC_5)* H13(NC_5)* H14(NC_5)* J1(NC_5)* J2(NC_5)* J3(NC_5)* J12(NC_5)* J13(NC_5)* J14(NC_5)* K1(NC_5)* K2(NC_5)* K3(NC_5)* K6(RFU_K6)* K7(RFU_K7)* K10(VSF4)* K12(NC_6)* K13(NC_6)* K14(NC_6)* L1(NC_6)* L2(NC_6)* L3(NC_6)* L12(NC_6)* L13(NC_6)* L14(NC_6)* M1(NC_6)* M2(NC_6)* M3(NC_6)* M7(NC_6)* M8(NC_7)* M9(NC_7)* M10(NC_7)* M11(NC_7)* M12(NC_7)* M13(NC_7)* M14(NC_7)* N1(NC_7)* N3(NC_7)* N6(NC_7)* N7(NC_7)* N8(NC_7)* N9(NC_7)* N10(NC_7)* N11(NC_8)* N12(NC_8)* N13(NC_8)* N14(NC_8)* P2(NC_8)* P7(RFU_P7)* P8(NC_8)* P9(NC_8)* P10(RFU_P10)* P11(NC_8)* P12(NC_8)* P13(NC_8)* P14(NC_8)*

### Layout directives
differential pair; differential pair class SD: SD_CMD, SD_DAT0, SD_DAT1, SD_DAT2, SD_DAT3

### Notes on the sheet
- (in symbol CMP-2000-05818-1) SHLD; SD CARD; CD/; DAT3

### Library data of the parts
C1 = CMP-001-00067-3: as C3 on sheet STM32H7; Min Operating Temperature: -55°C; Pins: 2; Case/Package: 0402; Max Operating Temperature: 85°C; Voltage Rating: 50V; Mounting Technology: SMT
eMMC = CMP-054-000000-1: eMMC 5.1 (HS400) 153B 16GB; MF: Kingston; MP: EMMC16G-TB29-90F01; Source: EMMC16G-TB29-90F01.SchLib; Pin Count: 153; Package: None; SnapEDA_Link: https://www.snapeda.com/parts/EMMC16G-TB29-90F01/Kingston/view-part/?ref=snap; Component Type: Standard; Design Item ID: EMMC16G-TB29-90F01; Value: *; Check_prices: https://www.snapeda.com/parts/EMMC16G-TB29-90F01/Kingston/view-part/?ref=eda
R0-R2 R4-R6 = CMP-009-00066-2: as R7 on sheet STM32H7; Case/Package: 0402; Mounting Technology: SMT; Pins: 2; Tolerance: 1%
SD = CMP-2000-05818-1: Assembly SD Card Reader, Famale, 11 Way, -40 to 105 degC, RoHS, Tape and Reel; Manufacturer: FCI Electronics; SVHC: NoSVHC(15-Jun-2015); Connector Type: MemoryCard; No. of Contacts: 11Contacts; Datasheet Version: Rev. K, 09/2014; Datasheet URL: https://datasheet.ciiva.com/1106/10067847-1106690.pdf; Package Reference: 10067847-001RLF; Product Range: -; Contact Material: CopperAlloy; Contact Plating: GoldPlatedContacts; Package Description: 11-Pin Surface Mount Device, Body 29 x 28.5 mm; Mounting Technology: SurfaceMount; Manufacturer URL: http://portal.fciconnect.com/

## Sheet Power_Sch.SchDoc
size A4; SheetNumber: 4; SheetTotal: 7
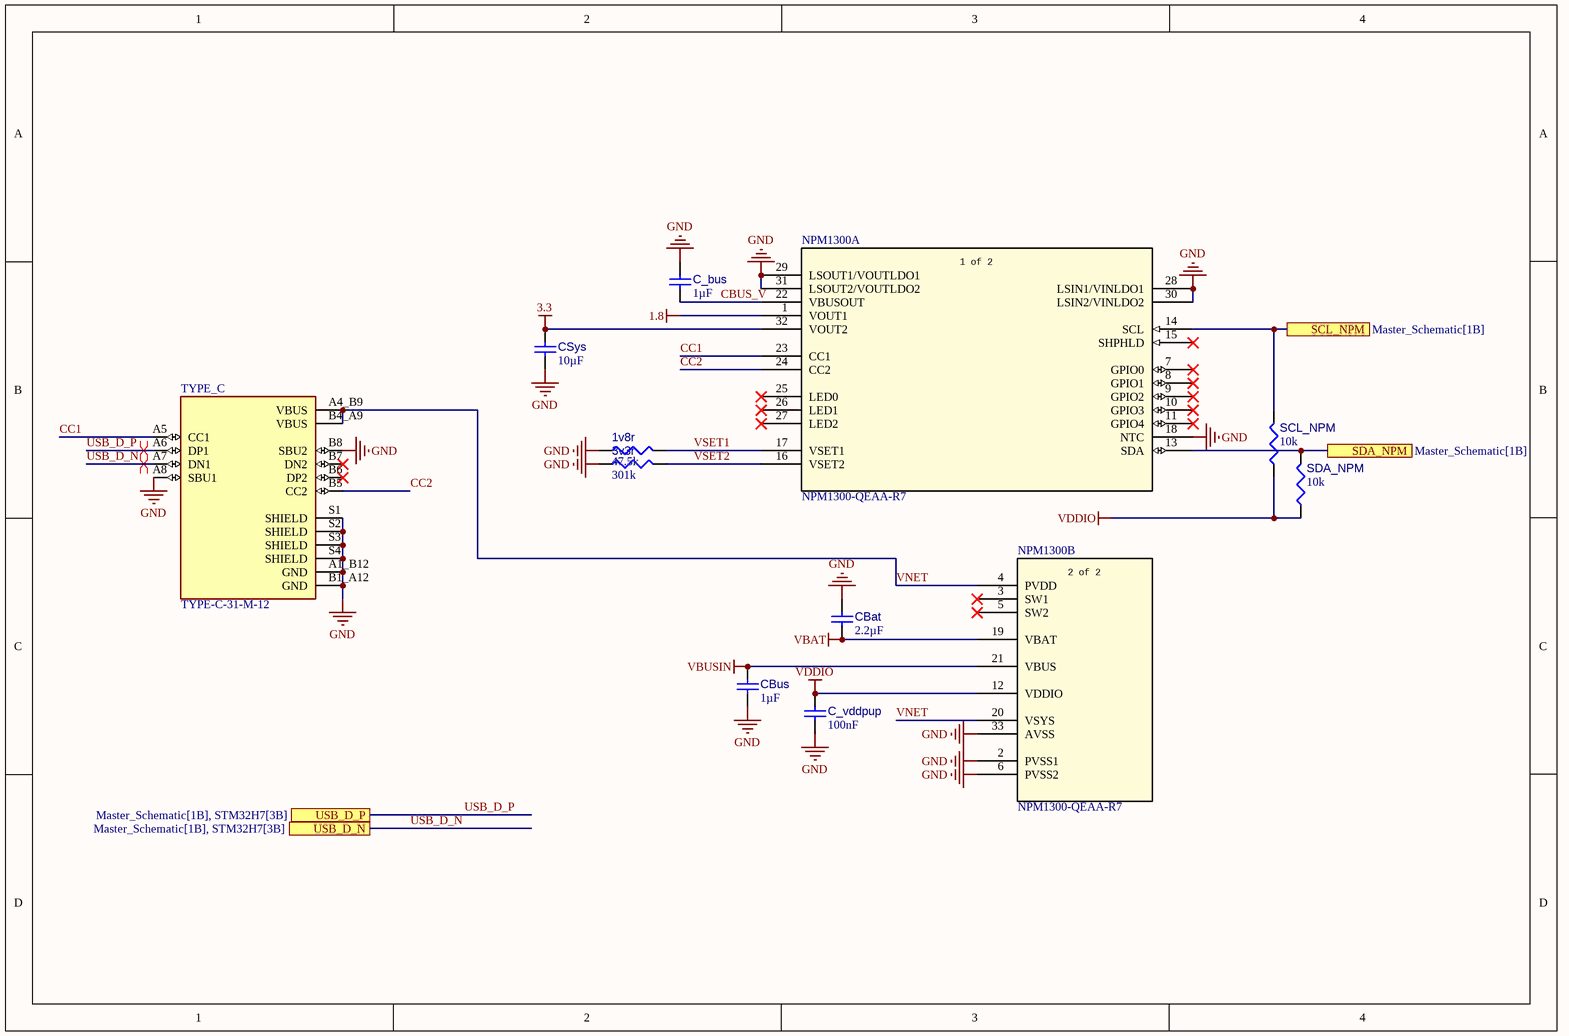
[diagram p4: Power_Sch.SchDoc]

### Parts
1v8r  value 47.5k  [RESC0402(1005)_L]  (hidden comment: Resistor 47K5 +/-1 % 0402 63 mW)
3v3r  value 301k  [RESC0402(1005)_L]  (hidden comment: 301KR2F)
C_bus  value 1µF  [CAPC1005X55X25LL05T10]  (hidden comment: Capacitor 1 uF +/- 10% 6.3 V 0402)
C_vddpup  value 100nF  [CAPC1608X90X40NL10T20]  (hidden comment: Capacitor 100 nF +/-10% 50 V 0603)
CBat  value 2.2µF  [CAPC0402(1005)60_L]  (hidden comment: Capacitor 2,2µF +/-20% 10V 0402)
CBus  value 1µF  [CAPC1005X55X25LL05T10]  (hidden comment: Capacitor 1 uF +/- 10% 6.3 V 0402)
CSys  value 10µF  [CAPC0805(2012)145_L]  (hidden comment: Capacitor 10µF +/-20% 25V 0805)
NPM1300  NPM1300-QEAA-R7  [QFN32_5X5_NOR]  (parts A,B of 2)
SCL_NPM  value 10k  [RESC0402(1005)_L]  (hidden comment: 10KR2F)
SDA_NPM  value 10k  [RESC0402(1005)_L]  (hidden comment: 10KR2F)
TYPE_C  TYPE-C-31-M-12  [HRO_TYPE-C-31-M-12]

### Ports
SCL_NPM (see Master_Schematic[1B]), SDA_NPM (see Master_Schematic[1B]), USB_D_N (see Master_Schematic[1B], STM32H7[3B]), USB_D_P (see Master_Schematic[1B], STM32H7[3B])

### Nets
1.8: NPM1300.1(VOUT1)  [project net VAL]
3.3: CSys.2 NPM1300.32(VOUT2)  [project net VCAP]
GND: 1v8r.1 3v3r.1 C_bus.2 C_vddpup.1 CBat.2 CBus.1 CSys.1 NPM1300.2(PVSS1) NPM1300.6(PVSS2) NPM1300.18(NTC) NPM1300.28(LSIN1/VINLDO1) NPM1300.29(LSOUT1/VOUTLDO1) NPM1300.30(LSIN2/VINLDO2) NPM1300.31(LSOUT2/VOUTLDO2) NPM1300.33(AVSS) TYPE_C.A1_B12(GND) TYPE_C.A8(SBU1) TYPE_C.B1_A12(GND) TYPE_C.B8(SBU2) TYPE_C.S1(SHIELD) TYPE_C.S2(SHIELD) TYPE_C.S3(SHIELD) TYPE_C.S4(SHIELD)
VBAT: CBat.1 NPM1300.19(VBAT)
VBUSIN: CBus.2 NPM1300.21(VBUS)
VDDIO: C_vddpup.2 NPM1300.12(VDDIO) SCL_NPM.1 SDA_NPM.1
CBUS_V: C_bus.1 NPM1300.22(VBUSOUT)
CC1: NPM1300.23(CC1) TYPE_C.A5(CC1)
CC2: NPM1300.24(CC2) TYPE_C.B5(CC2)
nPMSCL: NPM1300.14(SCL) SCL_NPM.2 ; port SCL_NPM
nPMSDA: NPM1300.13(SDA) SDA_NPM.2 ; port SDA_NPM
USB_D_N: TYPE_C.A7(DN1) ; port USB_D_N
USB_D_P: TYPE_C.A6(DP1) ; port USB_D_P
VNET: NPM1300.4(PVDD) NPM1300.20(VSYS) TYPE_C.A4_B9(VBUS) TYPE_C.B4_A9(VBUS)
VSET1: 1v8r.2 NPM1300.17(VSET1)
VSET2: 3v3r.2 NPM1300.16(VSET2)

Not connected (* = marked no-connect by the designer): NPM1300 3(SW1)* 5(SW2)* 7(GPIO0)* 8(GPIO1)* 9(GPIO2)* 10(GPIO3)* 11(GPIO4)* 15(SHPHLD)* 25(LED0)* 26(LED1)* 27(LED2)*; TYPE_C B6(DP2)* B7(DN2)*

### Layout directives
differential pair; differential pair class USB90C: USB_D_N, USB_D_P

### Notes on the sheet
- (in symbol CMP-052-000000-1, part A) 1 of 2
- (in symbol CMP-052-000000-1, part B) 2 of 2

### Library data of the parts
1v8r = CMP-009-00137-3: Chip Resistor, 47,5 kOhms, +/-1 %, 63 mW, -55 to 155 degC, 0402; Power: 63mW; Tolerance: 1%; Pins: 2; Case/Package: 0402; Min Operating Temperature: -55°C; Max Operating Temperature: 155°C
3v3r = CMP-009-00092-2: 301K 0.063W 1% 0402 (1005 Metric)  SMD; Power: 63mW; Tolerance: 1%; Mounting Technology: SMT; Case/Package: 0402; Pins: 2
C_bus CBus = CMP-001-00008-6: as C10 on sheet STM32H7; Max Operating Temperature: 85°C; Mounting Technology: SM; Tolerance: 10%; Case/Package: 0402; RoHS Compliant: True; Min Operating Temperature: -55°C; Pins: 2
C_vddpup = CMP-001-00017-6: as C14 on sheet STM32H7; Tolerance: 10%; Mounting Technology: SM; Max Operating Temperature: 125°C; RoHS Compliant: True; Pins: 2; Case/Package: 0603; Min Operating Temperature: -55°C
CBat = CMP-001-00056-4: as C11 on sheet STM32H7; Mounting Technology: SMT; Max Operating Temperature: 85°C; Case/Package: 0402; Pins: 2; Min Operating Temperature: -55°C; Voltage Rating: 10V
CSys = CMP-001-00079-4: Chip Capacitor, 10µF +/-20%, 25V, 0805, Thickness 1.45 mm; Tolerance: 10%; Max Operating Temperature: 85°C; Case/Package: 0805; Voltage Rating: 25V; Min Operating Temperature: -55°C; Mounting Technology: SMT; Pins: 2
NPM1300 = CMP-052-000000-1: Description; Manufacturer_Name: Nordic Semiconductor; Type: Type; Copyright: Copyright (C) 2026 Ultra Librarian. All rights reserved.; Source: NPM1300-QEAA-R7.SchLib; RefDes: RefDes; Manufacturer_Part_Number: NPM1300-QEAA-R7; Design Item ID: NPM1300-QEAA-R7
SCL_NPM SDA_NPM = CMP-009-00066-2: as R7 on sheet STM32H7; Case/Package: 0402; Mounting Technology: SMT; Pins: 2; Tolerance: 1%
TYPE_C = CMP-027-000000-1: USB Connectors 24 Receptacle 1 8.94*7.3mm RoHS; MF: HRO Electronics Co., Ltd.; Check_prices: https://www.snapeda.com/parts/TYPE-C-31-M-12/HRO+Electronics+Co.%252C+Ltd./view-part/?ref=eda; SnapEDA_Link: https://www.snapeda.com/parts/TYPE-C-31-M-12/HRO+Electronics+Co.%252C+Ltd./view-part/?ref=snap; Source: TYPE-C-31-M-12.SchLib; Value: *; MP: TYPE-C-31-M-12; Component Type: Standard; Design Item ID: TYPE-C-31-M-12; Pin Count: 16; Package: Package

## Sheet allparts.SchDoc
size A4; SheetNumber: 2; SheetTotal: 5
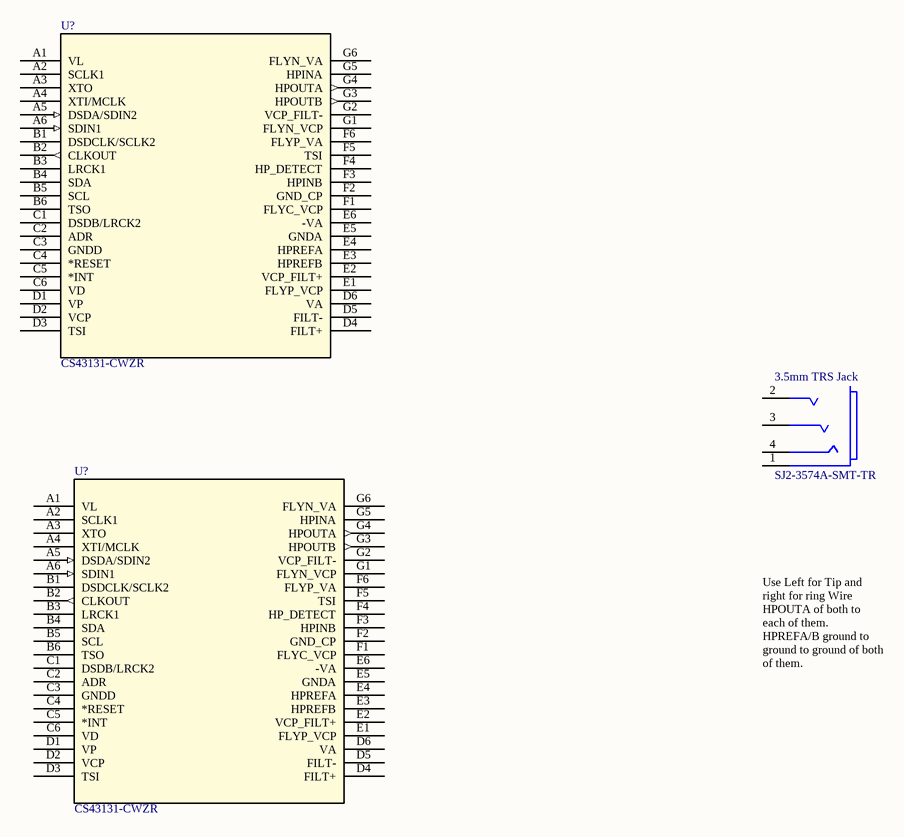
[diagram p5: allparts.SchDoc]

### Parts
(Parts that share a designator on the sheet are numbered #1, #2 ... from top to bottom, then left to right.)
3.5mm_TRS_Jack#2  SJ2-3574A-SMT-TR  [FP-SJ2-3574A-SMT-TR-MFG]
U?#1  CS43131-CWZR  [WLCSP42_CS43131-CWZR_CIR]
U?#2  CS43131-CWZR  [WLCSP42_CS43131-CWZR_CIR]

### Nets

Not connected (* = marked no-connect by the designer): 3.5mm_TRS_Jack#2 1(sleeve) 2(tip) 3(ring_1) 4(ring_2); U?#1 A1(VL) A2(SCLK1) A3(XTO) A4(XTI/MCLK) A5(DSDA/SDIN2) A6(SDIN1) B1(DSDCLK/SCLK2) B2(CLKOUT) B3(LRCK1) B4(SDA) B5(SCL) B6(TSO) C1(DSDB/LRCK2) C2(ADR) C3(GNDD) C4(*RESET) C5(*INT) C6(VD) D1(VP) D2(VCP) D3(TSI) D4(FILT+) D5(FILT-) D6(VA) E1(FLYP_VCP) E2(VCP_FILT+) E3(HPREFB) E4(HPREFA) E5(GNDA) E6(-VA) F1(FLYC_VCP) F2(GND_CP) F3(HPINB) F4(HP_DETECT) F5(TSI) F6(FLYP_VA) G1(FLYN_VCP) G2(VCP_FILT-) G3(HPOUTB) G4(HPOUTA) G5(HPINA) G6(FLYN_VA); U?#2 A1(VL) A2(SCLK1) A3(XTO) A4(XTI/MCLK) A5(DSDA/SDIN2) A6(SDIN1) B1(DSDCLK/SCLK2) B2(CLKOUT) B3(LRCK1) B4(SDA) B5(SCL) B6(TSO) C1(DSDB/LRCK2) C2(ADR) C3(GNDD) C4(*RESET) C5(*INT) C6(VD) D1(VP) D2(VCP) D3(TSI) D4(FILT+) D5(FILT-) D6(VA) E1(FLYP_VCP) E2(VCP_FILT+) E3(HPREFB) E4(HPREFA) E5(GNDA) E6(-VA) F1(FLYC_VCP) F2(GND_CP) F3(HPINB) F4(HP_DETECT) F5(TSI) F6(FLYP_VA) G1(FLYN_VCP) G2(VCP_FILT-) G3(HPOUTB) G4(HPOUTA) G5(HPINA) G6(FLYN_VA)

### Notes on the sheet
- Use Left for Tip and right for ring Wire HPOUTA of both to each of them. HPREFA/B ground to ground to ground of both of them.

### Library data of the parts
3.5mm_TRS_Jack#2 = CMP-14818-000001-1: as 3.5mm_TRS_Jack#1 on sheet Audio; Package: SJ2-3574A-SMT-TR; Device Class L1: Connectors; Lead Free: Yes; Digikey Description: AUDIO JACK, 3.5 MM, RT, 4 CONDUC; Device Class L2: Audio / Video Connectors; ComponentLink2URL: https://www.cui.com/product/resource/sj2-357x-smt.pdf; Automotive: No; RoHS: TRUE; Height: 5.3mm; Temperature Range Low: -25°C; Category: Conn; Temperature: -25°C to +85°C; Octopart: https://octopart.com/sj2-3574a-smt-tr-cui-77838840; Device Class L3: unset; Contact Material: Silver; Manufacturer Part Number: SJ2-3574A-SMT-TR; Temperature Range High: +85°C; ComponentLink2Description: Datasheet
U?#1 U?#2 = CMP-057-000000-1: as DAC_L on sheet Audio; Design Item ID: CS43131-CWZR; RefDes: RefDes; Source: CS43131-CWZR.SchLib; Manufacturer_Part_Number: CS43131-CWZR; Type: Type; Copyright: Copyright (C) 2025 Ultra Librarian. All rights reserved.

## Sheet Sheet2.SchDoc
size A4; SheetNumber: 3; SheetTotal: 3

## Nets that join several sheets
GND: STM32H7 (32 pins), Audio (36 pins), Storage (21 pins), Power_Sch (23 pins)
VAL: Audio (22 pins), Storage (7 pins), Power_Sch (NPM1300.1)
VCAP: STM32H7 (26 pins), Storage (11 pins), Power_Sch (CSys.2 NPM1300.32)
eMMC_CLK: STM32H7 (STM32H7.16), Storage (eMMC.M6)
eMMC_CMD: STM32H7 (STM32H7.22), Storage (eMMC.M5)
eMMC_D0: STM32H7 (STM32H7.53), Storage (eMMC.A3)
eMMC_D1: STM32H7 (STM32H7.54), Storage (eMMC.A4)
eMMC_D2: STM32H7 (STM32H7.89), Storage (eMMC.A5)
eMMC_D3: STM32H7 (STM32H7.90), Storage (eMMC.B2)
FS: STM32H7 (STM32H7.3), Audio (DAC_L.B3 DAC_R.B3)
I2C1_SCL: STM32H7 (STM32H7.92), Audio (DAC_R.B5)
I2C1_SDA: STM32H7 (STM32H7.93), Audio (DAC_R.B4)
I2C2_SCL: STM32H7 (STM32H7.46), Audio (DAC_L.B5)
I2C2_SDA: STM32H7 (STM32H7.47), Audio (DAC_L.B4)
MLCK: STM32H7 (STM32H7.1), Audio (DAC_L.A4 DAC_R.A4)
nPMSCL: STM32H7 (STM32H7.43), Power_Sch (NPM1300.14 SCL_NPM.2)
nPMSDA: STM32H7 (STM32H7.42), Power_Sch (NPM1300.13 SDA_NPM.2)
RESET_L: STM32H7 (STM32H7.37), Audio (DAC_L.C4)
RESET_R: STM32H7 (STM32H7.38), Audio (DAC_R.C4)
SAISCK: STM32H7 (STM32H7.4), Audio (DAC_L.A2 DAC_R.A2)
SD_A: STM32H7 (STM32H7.5), Audio (DAC_L.A6)
SD_B: STM32H7 (STM32H7.2), Audio (DAC_R.A6)
SD_CLK: STM32H7 (STM32H7.80), Storage (SD.5)
SD_CMD: STM32H7 (STM32H7.83), Storage (R4.2 SD.2)
SD_DAT0: STM32H7 (STM32H7.65), Storage (R2.2 SD.7)
SD_DAT1: STM32H7 (STM32H7.66), Storage (R1.2 SD.8)
SD_DAT2: STM32H7 (STM32H7.78), Storage (R0.2 SD.9)
SD_DAT3: STM32H7 (STM32H7.79), Storage (R5.2 SD.1)
USB_D_N: STM32H7 (STM32H7.70), Power_Sch (TYPE_C.A7)
USB_D_P: STM32H7 (STM32H7.71), Power_Sch (TYPE_C.A6)